# Altium project OmniCore_SDR.PrjPcb (part 1 of 3)
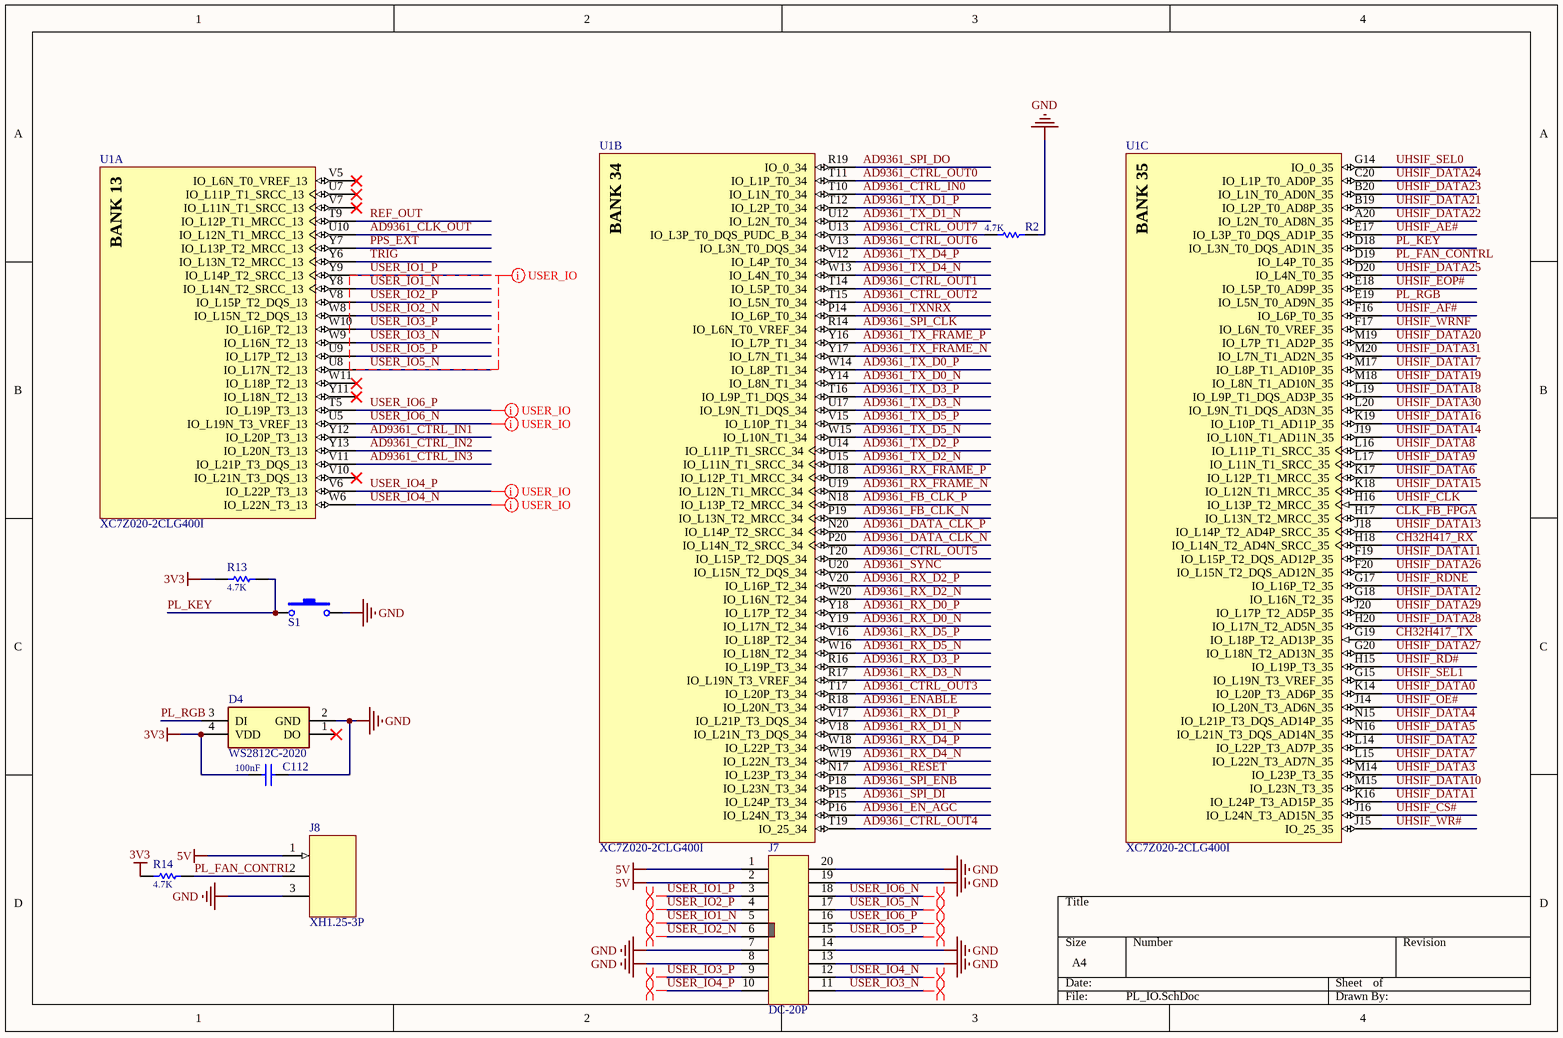
[diagram p0: PL_IO.SchDoc]
11 sheets, 534 parts. Net scope: global (net labels, ports and power ports of the same name join across sheets).
Board file: OmniCore_SDR.PcbDoc
Sheets:
  PL_IO.SchDoc
  PS_IO.SchDoc
  ZYNQ_Power.SchDoc
  DDR3.SchDoc
  LAN_SD.SchDoc
  JTAG.SchDoc
  AD9361.SchDoc
  AD9361_RF.SchDoc
  Sys_Power.SchDoc
  Clock.SchDoc
  CH32H417_USB3.SchDoc

## Sheet PL_IO.SchDoc
size A4; SheetNumber: 1; SheetTotal: 11

### Parts
C112  value 100nF  [C0402-L]  (hidden comment: Cap-S)
D4  WS2812C-2020  [WS2812C2020]
J7  DC-20P  [HDR-TH_20P-P2.54-V-M-R2-C10-S2.54]
J8  XH1.25-3P  [CONN-TH_3P-P1.25_CAX_1.25-3A]
R2  value 4.7K  [R0402-L]  (hidden comment: R)
R13  value 4.7K  [R0402-L]  (hidden comment: R)
R14  value 4.7K  [R0402-L]  (hidden comment: R)
S1  SW-PB2  [SW-PB2-SMD]  (value not drawn)
U1  XC7Z020-2CLG400I  [CLG400]  (parts A,B,C of 9)

### Nets
3V3: C112.1 D4.4(VDD) R13.1 R14.1
5V: J7.1 J7.2 J8.1
GND: C112.2 D4.2(GND) J7.7 J7.8 J7.13 J7.14 J7.19 J7.20 J8.3 R2.1 S1.2
AD9361_CLK_OUT: U1.U10(IO_L12N_T1_MRCC_13)
AD9361_CTRL_IN0: U1.T10(IO_L1N_T0_34)
AD9361_CTRL_IN1: U1.Y12(IO_L20P_T3_13)
AD9361_CTRL_IN2: U1.Y13(IO_L20N_T3_13)
AD9361_CTRL_IN3: U1.V11(IO_L21P_T3_DQS_13)
AD9361_CTRL_OUT0: U1.T11(IO_L1P_T0_34)
AD9361_CTRL_OUT1: U1.T14(IO_L5P_T0_34)
AD9361_CTRL_OUT2: U1.T15(IO_L5N_T0_34)
AD9361_CTRL_OUT3: U1.T17(IO_L20P_T3_34)
AD9361_CTRL_OUT4: U1.T19(IO_25_34)
AD9361_CTRL_OUT5: U1.T20(IO_L15P_T2_DQS_34)
AD9361_CTRL_OUT6: U1.V13(IO_L3N_T0_DQS_34)
AD9361_CTRL_OUT7: R2.2 U1.U13(IO_L3P_T0_DQS_PUDC_B_34)
AD9361_DATA_CLK_N: U1.P20(IO_L14N_T2_SRCC_34)
AD9361_DATA_CLK_P: U1.N20(IO_L14P_T2_SRCC_34)
AD9361_EN_AGC: U1.P16(IO_L24N_T3_34)
AD9361_ENABLE: U1.R18(IO_L20N_T3_34)
AD9361_FB_CLK_N: U1.P19(IO_L13N_T2_MRCC_34)
AD9361_FB_CLK_P: U1.N18(IO_L13P_T2_MRCC_34)
AD9361_RESET: U1.N17(IO_L23P_T3_34)
AD9361_RX_D0_N: U1.Y19(IO_L17N_T2_34)
AD9361_RX_D0_P: U1.Y18(IO_L17P_T2_34)
AD9361_RX_D1_N: U1.V18(IO_L21N_T3_DQS_34)
AD9361_RX_D1_P: U1.V17(IO_L21P_T3_DQS_34)
AD9361_RX_D2_N: U1.W20(IO_L16N_T2_34)
AD9361_RX_D2_P: U1.V20(IO_L16P_T2_34)
AD9361_RX_D3_N: U1.R17(IO_L19N_T3_VREF_34)
AD9361_RX_D3_P: U1.R16(IO_L19P_T3_34)
AD9361_RX_D4_N: U1.W19(IO_L22N_T3_34)
AD9361_RX_D4_P: U1.W18(IO_L22P_T3_34)
AD9361_RX_D5_N: U1.W16(IO_L18N_T2_34)
AD9361_RX_D5_P: U1.V16(IO_L18P_T2_34)
AD9361_RX_FRAME_N: U1.U19(IO_L12N_T1_MRCC_34)
AD9361_RX_FRAME_P: U1.U18(IO_L12P_T1_MRCC_34)
AD9361_SPI_CLK: U1.R14(IO_L6N_T0_VREF_34)
AD9361_SPI_DI: U1.P15(IO_L24P_T3_34)
AD9361_SPI_DO: U1.R19(IO_0_34)
AD9361_SPI_ENB: U1.P18(IO_L23N_T3_34)
AD9361_SYNC: U1.U20(IO_L15N_T2_DQS_34)
AD9361_TX_D0_N: U1.Y14(IO_L8N_T1_34)
AD9361_TX_D0_P: U1.W14(IO_L8P_T1_34)
AD9361_TX_D1_N: U1.U12(IO_L2N_T0_34)
AD9361_TX_D1_P: U1.T12(IO_L2P_T0_34)
AD9361_TX_D2_N: U1.U15(IO_L11N_T1_SRCC_34)
AD9361_TX_D2_P: U1.U14(IO_L11P_T1_SRCC_34)
AD9361_TX_D3_N: U1.U17(IO_L9N_T1_DQS_34)
AD9361_TX_D3_P: U1.T16(IO_L9P_T1_DQS_34)
AD9361_TX_D4_N: U1.W13(IO_L4N_T0_34)
AD9361_TX_D4_P: U1.V12(IO_L4P_T0_34)
AD9361_TX_D5_N: U1.W15(IO_L10N_T1_34)
AD9361_TX_D5_P: U1.V15(IO_L10P_T1_34)
AD9361_TX_FRAME_N: U1.Y17(IO_L7N_T1_34)
AD9361_TX_FRAME_P: U1.Y16(IO_L7P_T1_34)
AD9361_TXNRX: U1.P14(IO_L6P_T0_34)
CH32H417_RX: U1.H18(IO_L14N_T2_AD4N_SRCC_35)
CH32H417_TX: U1.G19(IO_L18P_T2_AD13P_35)
CLK_FB_FPGA: U1.H17(IO_L13N_T2_MRCC_35)
PL_FAN_CONTRL: J8.2 R14.2 U1.D19(IO_L4P_T0_35)
PL_KEY: R13.2 S1.1 U1.D18(IO_L3N_T0_DQS_AD1N_35)
PL_RGB: D4.3(DI) U1.E19(IO_L5N_T0_AD9N_35)
PPS_EXT: U1.Y7(IO_L13P_T2_MRCC_13)
REF_OUT: U1.T9(IO_L12P_T1_MRCC_13)
TRIG: U1.Y6(IO_L13N_T2_MRCC_13)
UHSIF_AE#: U1.E17(IO_L3P_T0_DQS_AD1P_35)
UHSIF_AF#: U1.F16(IO_L6P_T0_35)
UHSIF_CLK: U1.H16(IO_L13P_T2_MRCC_35)
UHSIF_CS#: U1.J16(IO_L24N_T3_AD15N_35)
UHSIF_DATA0: U1.K14(IO_L20P_T3_AD6P_35)
UHSIF_DATA1: U1.K16(IO_L24P_T3_AD15P_35)
UHSIF_DATA2: U1.L14(IO_L22P_T3_AD7P_35)
UHSIF_DATA3: U1.M14(IO_L23P_T3_35)
UHSIF_DATA4: U1.N15(IO_L21P_T3_DQS_AD14P_35)
UHSIF_DATA5: U1.N16(IO_L21N_T3_DQS_AD14N_35)
UHSIF_DATA6: U1.K17(IO_L12P_T1_MRCC_35)
UHSIF_DATA7: U1.L15(IO_L22N_T3_AD7N_35)
UHSIF_DATA8: U1.L16(IO_L11P_T1_SRCC_35)
UHSIF_DATA9: U1.L17(IO_L11N_T1_SRCC_35)
UHSIF_DATA10: U1.M15(IO_L23N_T3_35)
UHSIF_DATA11: U1.F19(IO_L15P_T2_DQS_AD12P_35)
UHSIF_DATA12: U1.G18(IO_L16N_T2_35)
UHSIF_DATA13: U1.J18(IO_L14P_T2_AD4P_SRCC_35)
UHSIF_DATA14: U1.J19(IO_L10N_T1_AD11N_35)
UHSIF_DATA15: U1.K18(IO_L12N_T1_MRCC_35)
UHSIF_DATA16: U1.K19(IO_L10P_T1_AD11P_35)
UHSIF_DATA17: U1.M17(IO_L8P_T1_AD10P_35)
UHSIF_DATA18: U1.L19(IO_L9P_T1_DQS_AD3P_35)
UHSIF_DATA19: U1.M18(IO_L8N_T1_AD10N_35)
UHSIF_DATA20: U1.M19(IO_L7P_T1_AD2P_35)
UHSIF_DATA21: U1.B19(IO_L2P_T0_AD8P_35)
UHSIF_DATA22: U1.A20(IO_L2N_T0_AD8N_35)
UHSIF_DATA23: U1.B20(IO_L1N_T0_AD0N_35)
UHSIF_DATA24: U1.C20(IO_L1P_T0_AD0P_35)
UHSIF_DATA25: U1.D20(IO_L4N_T0_35)
UHSIF_DATA26: U1.F20(IO_L15N_T2_DQS_AD12N_35)
UHSIF_DATA27: U1.G20(IO_L18N_T2_AD13N_35)
UHSIF_DATA28: U1.H20(IO_L17N_T2_AD5N_35)
UHSIF_DATA29: U1.J20(IO_L17P_T2_AD5P_35)
UHSIF_DATA30: U1.L20(IO_L9N_T1_DQS_AD3N_35)
UHSIF_DATA31: U1.M20(IO_L7N_T1_AD2N_35)
UHSIF_EOP#: U1.E18(IO_L5P_T0_AD9P_35)
UHSIF_OE#: U1.J14(IO_L20N_T3_AD6N_35)
UHSIF_RD#: U1.H15(IO_L19P_T3_35)
UHSIF_RDNE: U1.G17(IO_L16P_T2_35)
UHSIF_SEL0: U1.G14(IO_0_35)
UHSIF_SEL1: U1.G15(IO_L19N_T3_VREF_35)
UHSIF_WR#: U1.J15(IO_25_35)
UHSIF_WRNF: U1.F17(IO_L6N_T0_VREF_35)
USER_IO1_N: J7.5 U1.Y8(IO_L14N_T2_SRCC_13)
USER_IO1_P: J7.3 U1.Y9(IO_L14P_T2_SRCC_13)
USER_IO2_N: J7.6 U1.W8(IO_L15N_T2_DQS_13)
USER_IO2_P: J7.4 U1.V8(IO_L15P_T2_DQS_13)
USER_IO3_N: J7.11 U1.W9(IO_L16N_T2_13)
USER_IO3_P: J7.9 U1.W10(IO_L16P_T2_13)
USER_IO4_N: J7.12 U1.W6(IO_L22N_T3_13)
USER_IO4_P: J7.10 U1.V6(IO_L22P_T3_13)
USER_IO5_N: J7.17 U1.U8(IO_L17N_T2_13)
USER_IO5_P: J7.15 U1.U9(IO_L17P_T2_13)
USER_IO6_N: J7.18 U1.U5(IO_L19N_T3_VREF_13)
USER_IO6_P: J7.16 U1.T5(IO_L19P_T3_13)

Not connected (* = marked no-connect by the designer): D4 1(DO)*; U1 U7(IO_L11P_T1_SRCC_13)* V5(IO_L6N_T0_VREF_13)* V7(IO_L11N_T1_SRCC_13)* V10(IO_L21N_T3_DQS_13)* W11(IO_L18P_T2_13)* Y11(IO_L18N_T2_13)*

### Layout directives
net class USER_IO: USER_IO1_N, USER_IO1_P, USER_IO2_N, USER_IO2_P, USER_IO3_N, USER_IO3_P, USER_IO4_N, USER_IO4_P, USER_IO5_N, USER_IO5_P, USER_IO6_N, USER_IO6_P
differential pair: USER_IO1_N, USER_IO1_P, USER_IO2_N, USER_IO2_P, USER_IO3_N, USER_IO3_P, USER_IO4_N, USER_IO4_P, USER_IO5_N, USER_IO5_P, USER_IO6_N, USER_IO6_P

### Notes on the sheet
- (in symbol CMP-0363-00003-3, part A) BANK 13
- (in symbol CMP-0363-00003-3, part B) BANK 34
- (in symbol CMP-0363-00003-3, part C) BANK 35

### Library data of the parts
C112 = Cap-S: 贴片瓷片电容
D4 = WS2812C-2020: Intelligent control LED integrated light source; Manufacturer_Name: Worldsemi; Geometry.Height: 0.84mm; Manufacturer_Part_Number: WS2812C-2020; Mouser Part Number: *; Mouser Price/Stock: *; Arrow Part Number: *; Arrow Price/Stock: *; Datasheet Link: http://www.world-semi.com/DownLoadFile/139
R2 R13 R14 = Res: 贴片电阻
S1 = SW-PB2: 贴片式2脚微动开关
U1 = CMP-0363-00003-3: 733 MHz Zynq™-7000 AP SoC, 130 PS I/O, 125 FPGA I/O, 400-Ball BGA, Speed Grade 2, Industrial Grade, Pb-Free; LUTs: 53200; Flip Flops: 106400; Speed Grade: -2; Extensible Block RAM (# 36Kb Blocks): 560 KB (140); ComponentLink2URL: http://www.xilinx.com/support/documentation/user_guides/ug865-Zynq-7000-Pkg-Pinout.pdf; ComponentLink1Description: Datasheet; PartNumber: XC7Z020-2CLG400I; ComponentLink3URL: http://www.xilinx.com/support/documentation/data_sheets/ds187-XC7Z010-XC7Z020-Data-Sheet.pdf; Mounting Technology: Surface Mount; ComponentLink6Description: PCB and Layout Guide; ComponentLink3Description: DC and AC Switching Characteristics; ComponentLink4Description: Package File; PackageVersion: Rev 1.1, 09/2012; ComponentLink6URL: http://www.xilinx.com/support/documentation/user_guides/ug483_7Series_PCB.pdf; PackageDescription: Wire-Bond Chip-Scale BGA, Body 17 x 17 mm, 0.8 mm Pitch; ComponentLink5Description: Packaging and Pinout; Generic Part Number: XC7Z020; RoHS: Pb-Free; PackageReference: CLG400; ComponentLink1URL: http://www.xilinx.com/support/documentation/data_sheets/ds190-Zynq-7000-Overview.pdf; ComponentLink2Description: Package Specification; ComponentLink5URL: http://www.xilinx.com/support/documentation/user_guides/ug865-Zynq-7000-Pkg-Pinout.pdf; DatasheetVersion: v1.2; ComponentLink4URL: http://www.xilinx.com/support/packagefiles/z7packages/xc7z020clg400pkg.txt; Code_JEDEC: MO-275-MMAA-1

## Sheet PS_IO.SchDoc
size A4; SheetNumber: 2; SheetTotal: 11
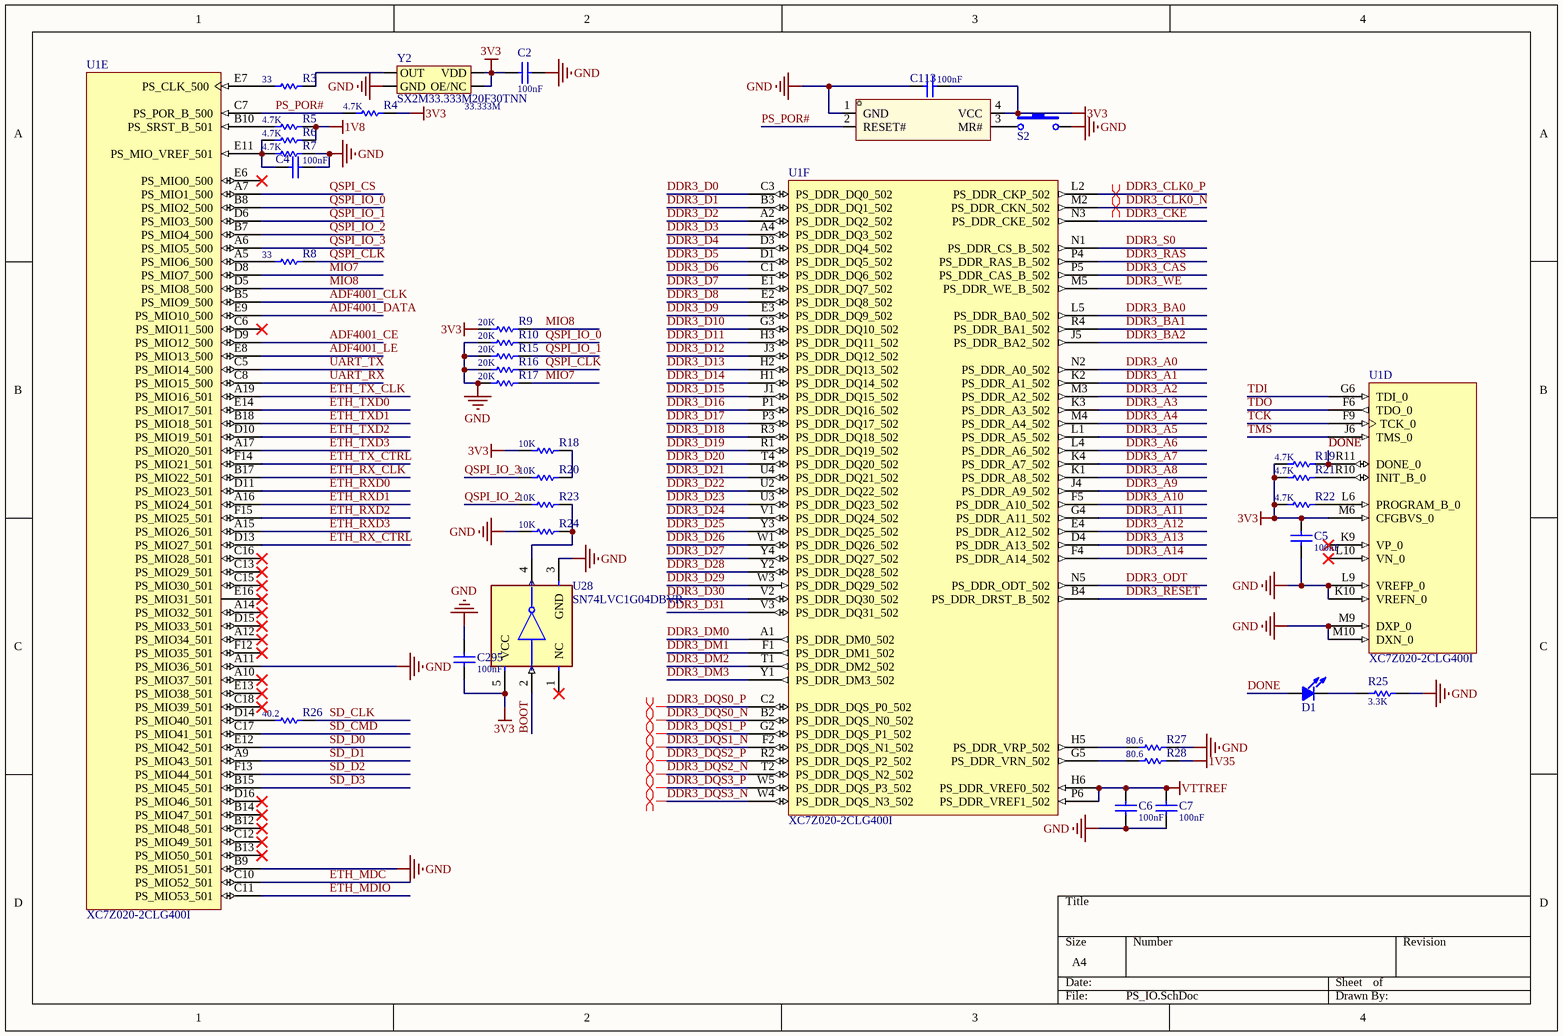
[diagram p1: PS_IO.SchDoc]

### Parts
C2  value 100nF  [C0402-L]  (hidden comment: Cap-S)
C4  value 100nF  [C0402-L]  (hidden comment: Cap-S)
C5  value 100nF  [C0402-L]  (hidden comment: Cap-S)
C6  value 100nF  [C0402-S]  (hidden comment: Cap-S)
C7  value 100nF  [C0402-S]  (hidden comment: Cap-S)
C113  value 100nF  [C0402-L]  (hidden comment: Cap-S)
C295  value 100nF  [C0402-L]  (hidden comment: Cap-S)
D1  LED  [LED_0603_L]  (value not drawn)
R3  value 33  [R0402-L]  (hidden comment: R)
R4  value 4.7K  [R0402-L]  (hidden comment: R)
R5  value 4.7K  [R0402-L]  (hidden comment: R)
R6  value 4.7K  [R0402-L]  (hidden comment: R)
R7  value 4.7K  [R0402-L]  (hidden comment: R)
R8  value 33  [R0402-L]  (hidden comment: R)
R9  value 20K  [R0402-L]  (hidden comment: R)
R10  value 20K  [R0402-L]  (hidden comment: R)
R15  value 20K  [R0402-L]  (hidden comment: R)
R16  value 20K  [R0402-L]  (hidden comment: R)
R17  value 20K  [R0402-L]  (hidden comment: R)
R18  value 10K  [R0402-L]  (hidden comment: R)
R19  value 4.7K  [R0402-L]  (hidden comment: R)
R20  value 10K  [R0402-L]  (hidden comment: R)
R21  value 4.7K  [R0402-L]  (hidden comment: R)
R22  value 4.7K  [R0402-L]  (hidden comment: R)
R23  value 10K  [R0402-L]  (hidden comment: R)
R24  value 10K  [R0402-L]  (hidden comment: R)
R25  value 3.3K  [R0603-L]  (hidden comment: R)
R26  value 40.2  [R0402-L]  (hidden comment: R)
R27  value 80.6  [R0402-S]  (hidden comment: R)
R28  value 80.6  [R0402-S]  (hidden comment: R)
S2  SW-PB2  [SW-PB2-SMD]  (value not drawn)
U1  XC7Z020-2CLG400I  [CLG400]  (parts D,E,F of 9)
U9  HX811T  [SOT-143_L2.9-W1.3-P1.92-LS2.3-BL]  (value not drawn)
U28  SN74LVC1G04DBVR  [FP-DBV0005A-IPC_C]
Y2  SX2M33.333M20F30TNN  value 33.333M  [XTAL-2520]

### Nets
1V8: R5.1 R6.1
1V35: R28.1
3V3: C2.2 C5.1 C113.1 C295.2 R4.1 R9.2 R18.2 R19.2 R21.2 R22.2 U1.M6(CFGBVS_0) U9.4(VCC) U28.5(VCC) Y2.1(OE/NC) Y2.4(VDD)
GND: C2.1 C4.1 C5.2 C6.1 C7.1 C113.2 C295.1 R7.1 R10.2 R15.2 R16.2 R17.2 R24.2 R25.2 R27.1 S2.2 U1.A11(PS_MIO36_501) U1.B9(PS_MIO51_501) U1.K10(VREFN_0) U1.L9(VREFP_0) U1.M9(DXP_0) U1.M10(DXN_0) U9.1(GND) U28.3(GND) Y2.2(GND)
VTTREF: C6.2 C7.2 U1.H6(PS_DDR_VREF0_502) U1.P6(PS_DDR_VREF1_502)
ADF4001_CE: U1.D9(PS_MIO12_500)
ADF4001_CLK: U1.B5(PS_MIO9_500)
ADF4001_DATA: U1.E9(PS_MIO10_500)
ADF4001_LE: U1.E8(PS_MIO13_500)
BOOT: U28.2(A)
DDR3_A0: U1.N2(PS_DDR_A0_502)
DDR3_A1: U1.K2(PS_DDR_A1_502)
DDR3_A2: U1.M3(PS_DDR_A2_502)
DDR3_A3: U1.K3(PS_DDR_A3_502)
DDR3_A4: U1.M4(PS_DDR_A4_502)
DDR3_A5: U1.L1(PS_DDR_A5_502)
DDR3_A6: U1.L4(PS_DDR_A6_502)
DDR3_A7: U1.K4(PS_DDR_A7_502)
DDR3_A8: U1.K1(PS_DDR_A8_502)
DDR3_A9: U1.J4(PS_DDR_A9_502)
DDR3_A10: U1.F5(PS_DDR_A10_502)
DDR3_A11: U1.G4(PS_DDR_A11_502)
DDR3_A12: U1.E4(PS_DDR_A12_502)
DDR3_A13: U1.D4(PS_DDR_A13_502)
DDR3_A14: U1.F4(PS_DDR_A14_502)
DDR3_BA0: U1.L5(PS_DDR_BA0_502)
DDR3_BA1: U1.R4(PS_DDR_BA1_502)
DDR3_BA2: U1.J5(PS_DDR_BA2_502)
DDR3_CAS: U1.P5(PS_DDR_CAS_B_502)
DDR3_CKE: U1.N3(PS_DDR_CKE_502)
DDR3_CLK0_N: U1.M2(PS_DDR_CKN_502)
DDR3_CLK0_P: U1.L2(PS_DDR_CKP_502)
DDR3_D0: U1.C3(PS_DDR_DQ0_502)
DDR3_D1: U1.B3(PS_DDR_DQ1_502)
DDR3_D2: U1.A2(PS_DDR_DQ2_502)
DDR3_D3: U1.A4(PS_DDR_DQ3_502)
DDR3_D4: U1.D3(PS_DDR_DQ4_502)
DDR3_D5: U1.D1(PS_DDR_DQ5_502)
DDR3_D6: U1.C1(PS_DDR_DQ6_502)
DDR3_D7: U1.E1(PS_DDR_DQ7_502)
DDR3_D8: U1.E2(PS_DDR_DQ8_502)
DDR3_D9: U1.E3(PS_DDR_DQ9_502)
DDR3_D10: U1.G3(PS_DDR_DQ10_502)
DDR3_D11: U1.H3(PS_DDR_DQ11_502)
DDR3_D12: U1.J3(PS_DDR_DQ12_502)
DDR3_D13: U1.H2(PS_DDR_DQ13_502)
DDR3_D14: U1.H1(PS_DDR_DQ14_502)
DDR3_D15: U1.J1(PS_DDR_DQ15_502)
DDR3_D16: U1.P1(PS_DDR_DQ16_502)
DDR3_D17: U1.P3(PS_DDR_DQ17_502)
DDR3_D18: U1.R3(PS_DDR_DQ18_502)
DDR3_D19: U1.R1(PS_DDR_DQ19_502)
DDR3_D20: U1.T4(PS_DDR_DQ20_502)
DDR3_D21: U1.U4(PS_DDR_DQ21_502)
DDR3_D22: U1.U2(PS_DDR_DQ22_502)
DDR3_D23: U1.U3(PS_DDR_DQ23_502)
DDR3_D24: U1.V1(PS_DDR_DQ24_502)
DDR3_D25: U1.Y3(PS_DDR_DQ25_502)
DDR3_D26: U1.W1(PS_DDR_DQ26_502)
DDR3_D27: U1.Y4(PS_DDR_DQ27_502)
DDR3_D28: U1.Y2(PS_DDR_DQ28_502)
DDR3_D29: U1.W3(PS_DDR_DQ29_502)
DDR3_D30: U1.V2(PS_DDR_DQ30_502)
DDR3_D31: U1.V3(PS_DDR_DQ31_502)
DDR3_DM0: U1.A1(PS_DDR_DM0_502)
DDR3_DM1: U1.F1(PS_DDR_DM1_502)
DDR3_DM2: U1.T1(PS_DDR_DM2_502)
DDR3_DM3: U1.Y1(PS_DDR_DM3_502)
DDR3_DQS0_N: U1.B2(PS_DDR_DQS_N0_502)
DDR3_DQS0_P: U1.C2(PS_DDR_DQS_P0_502)
DDR3_DQS1_N: U1.F2(PS_DDR_DQS_N1_502)
DDR3_DQS1_P: U1.G2(PS_DDR_DQS_P1_502)
DDR3_DQS2_N: U1.T2(PS_DDR_DQS_N2_502)
DDR3_DQS2_P: U1.R2(PS_DDR_DQS_P2_502)
DDR3_DQS3_N: U1.W4(PS_DDR_DQS_N3_502)
DDR3_DQS3_P: U1.W5(PS_DDR_DQS_P3_502)
DDR3_ODT: U1.N5(PS_DDR_ODT_502)
DDR3_RAS: U1.P4(PS_DDR_RAS_B_502)
DDR3_RESET: U1.B4(PS_DDR_DRST_B_502)
DDR3_S0: U1.N1(PS_DDR_CS_B_502)
DDR3_WE: U1.M5(PS_DDR_WE_B_502)
DONE: D1.1 R19.1 U1.R11(DONE_0)
ETH_MDC: U1.C10(PS_MIO52_501)
ETH_MDIO: U1.C11(PS_MIO53_501)
ETH_RX_CLK: U1.B17(PS_MIO22_501)
ETH_RX_CTRL: U1.D13(PS_MIO27_501)
ETH_RXD0: U1.D11(PS_MIO23_501)
ETH_RXD1: U1.A16(PS_MIO24_501)
ETH_RXD2: U1.F15(PS_MIO25_501)
ETH_RXD3: U1.A15(PS_MIO26_501)
ETH_TX_CLK: U1.A19(PS_MIO16_501)
ETH_TX_CTRL: U1.F14(PS_MIO21_501)
ETH_TXD0: U1.E14(PS_MIO17_501)
ETH_TXD1: U1.B18(PS_MIO18_501)
ETH_TXD2: U1.D10(PS_MIO19_501)
ETH_TXD3: U1.A17(PS_MIO20_501)
MIO7: R17.1 U1.D8(PS_MIO7_500)
MIO8: R9.1 U1.D5(PS_MIO8_500)
PS_POR#: R4.2 U1.C7(PS_POR_B_500) U9.2(RESET#)
QSPI_CLK: R8.1 R16.1
QSPI_CS: U1.A7(PS_MIO1_500)
QSPI_IO_0: R10.1 U1.B8(PS_MIO2_500)
QSPI_IO_1: R15.1 U1.D6(PS_MIO3_500)
QSPI_IO_2: R23.2 U1.B7(PS_MIO4_500)
QSPI_IO_3: R20.2 U1.A6(PS_MIO5_500)
SD_CLK: R26.1
SD_CMD: U1.C17(PS_MIO41_501)
SD_D0: U1.E12(PS_MIO42_501)
SD_D1: U1.A9(PS_MIO43_501)
SD_D2: U1.F13(PS_MIO44_501)
SD_D3: U1.B15(PS_MIO45_501)
TCK: U1.F9(TCK_0)
TDI: U1.G6(TDI_0)
TDO: U1.F6(TDO_0)
TMS: U1.J6(TMS_0)
UART_RX: U1.C8(PS_MIO15_500)
UART_TX: U1.C5(PS_MIO14_500)
NetC4_2: C4.2 R6.2 R7.2 U1.E11(PS_MIO_VREF_501)
NetD1_2: D1.2 R25.1
NetR3_1: R3.1 Y2.3(OUT)
NetR3_2: R3.2 U1.E7(PS_CLK_500)
NetR5_2: R5.2 U1.B10(PS_SRST_B_501)
NetR8_2: R8.2 U1.A5(PS_MIO6_500)
NetR18_1: R18.1 R20.1
NetR21_1: R21.1 U1.R10(INIT_B_0)
NetR22_1: R22.1 U1.L6(PROGRAM_B_0)
NetR23_1: R23.1 R24.1 U28.4(Y)
NetR26_2: R26.2 U1.D14(PS_MIO40_501)
NetR27_2: R27.2 U1.H5(PS_DDR_VRP_502)
NetR28_2: R28.2 U1.G5(PS_DDR_VRN_502)
NetS2_1: S2.1 U9.3(MR#)

Not connected (* = marked no-connect by the designer): U1 A10(PS_MIO37_501)* A12(PS_MIO34_501)* A14(PS_MIO32_501)* B12(PS_MIO48_501)* B13(PS_MIO50_501)* B14(PS_MIO47_501)* C6(PS_MIO11_500)* C12(PS_MIO49_501)* C13(PS_MIO29_501)* C15(PS_MIO30_501)* C16(PS_MIO28_501)* C18(PS_MIO39_501)* D15(PS_MIO33_501)* D16(PS_MIO46_501)* E6(PS_MIO0_500)* E13(PS_MIO38_501)* E16(PS_MIO31_501)* F12(PS_MIO35_501)* K9(VP_0)* L10(VN_0)*; U28 1(NC)*

### Layout directives
differential pair: DDR3_CLK0_N, DDR3_CLK0_P, DDR3_DQS0_N, DDR3_DQS0_P, DDR3_DQS1_N, DDR3_DQS1_P, DDR3_DQS2_N, DDR3_DQS2_P, DDR3_DQS3_N, DDR3_DQS3_P

### Library data of the parts
C2 C4-C7 C113 C295 = Cap-S: 贴片瓷片电容
D1 = LED: 发光二极管
R3-R10 R15-R28 = Res: 贴片电阻
S2 = SW-PB2: 贴片式2脚微动开关
U1 = CMP-0363-00003-3: as U1 on sheet PL_IO; ComponentLink2URL: http://www.xilinx.com/support/documentation/user_guides/ug865-Zynq-7000-Pkg-Pinout.pdf; ComponentLink1Description: Datasheet; PartNumber: XC7Z020-2CLG400I; ComponentLink3URL: http://www.xilinx.com/support/documentation/data_sheets/ds187-XC7Z010-XC7Z020-Data-Sheet.pdf; Mounting Technology: Surface Mount; ComponentLink6Description: PCB and Layout Guide; ComponentLink3Description: DC and AC Switching Characteristics; ComponentLink4Description: Package File; PackageVersion: Rev 1.1, 09/2012; ComponentLink6URL: http://www.xilinx.com/support/documentation/user_guides/ug483_7Series_PCB.pdf; PackageDescription: Wire-Bond Chip-Scale BGA, Body 17 x 17 mm, 0.8 mm Pitch; ComponentLink5Description: Packaging and Pinout; Generic Part Number: XC7Z020; RoHS: Pb-Free; PackageReference: CLG400; ComponentLink1URL: http://www.xilinx.com/support/documentation/data_sheets/ds190-Zynq-7000-Overview.pdf; ComponentLink2Description: Package Specification; ComponentLink5URL: http://www.xilinx.com/support/documentation/user_guides/ug865-Zynq-7000-Pkg-Pinout.pdf; DatasheetVersion: v1.2; ComponentLink4URL: http://www.xilinx.com/support/packagefiles/z7packages/xc7z020clg400pkg.txt; Code_JEDEC: MO-275-MMAA-1
U9 = HX811T: Manufacturer: HX(恒佳兴); Add into BOM: yes; Symbol: HX811T; Device: HX811T; LCSC Part Name: 检测复位IC  HX811T; Supplier Part: C296128; Manufacturer Part: HX811T; Supplier Footprint: SOT-143; JLCPCB Part Class: Extended Part; Datasheet: https://atta.szlcsc.com/upload/public/pdf/source/20181119/C296130_13C074D56463349345A6B8D040F0FFA0.pdf; Supplier: LCSC; Convert to PCB: yes
U28 = CMP-04903-000078-1: IC INVERTER 1CH 1-INP SOT23-5; Logic Function: Buffer; Number of Bits: 1; Voltage Rating (AC): 250V; Min Supply Voltage: 1.65V; Capacitance: 22nF; Propagation Delay: 3.7ns; Tolerance: 5%; High Level Output Current: -32mA; Turn-On Delay Time: 7.5ns; Voltage Rating (DC): 400V; Output Current: 32mA; Dielectric Material: PP; Quiescent Current: 10uA; Max Supply Voltage: 5.5V; REACH SVHC: No SVHC; Case/Package: SOT-23-5; Number of Pins: 5; Min Operating Temperature: -40°C; Technology: CMOS; Number of Inputs: 1; Weight: 0.000557oz; Radiation Hardening: No; Packaging: Tape and Reel; RoHS Compliant: Yes; Package Quantity: 3000; Number of Gates: 1; Lead Free: Lead Free; Termination: PC Pins; Mount: Surface Mount; Series: 74LVC; Number of Elements: 1; Number of Circuits: 1; Max Operating Temperature: 125°C; Low Level Output Current: 32mA
Y2 = XTALS: 贴片有源晶振

## Sheet ZYNQ_Power.SchDoc
size A4; SheetNumber: 3; SheetTotal: 11
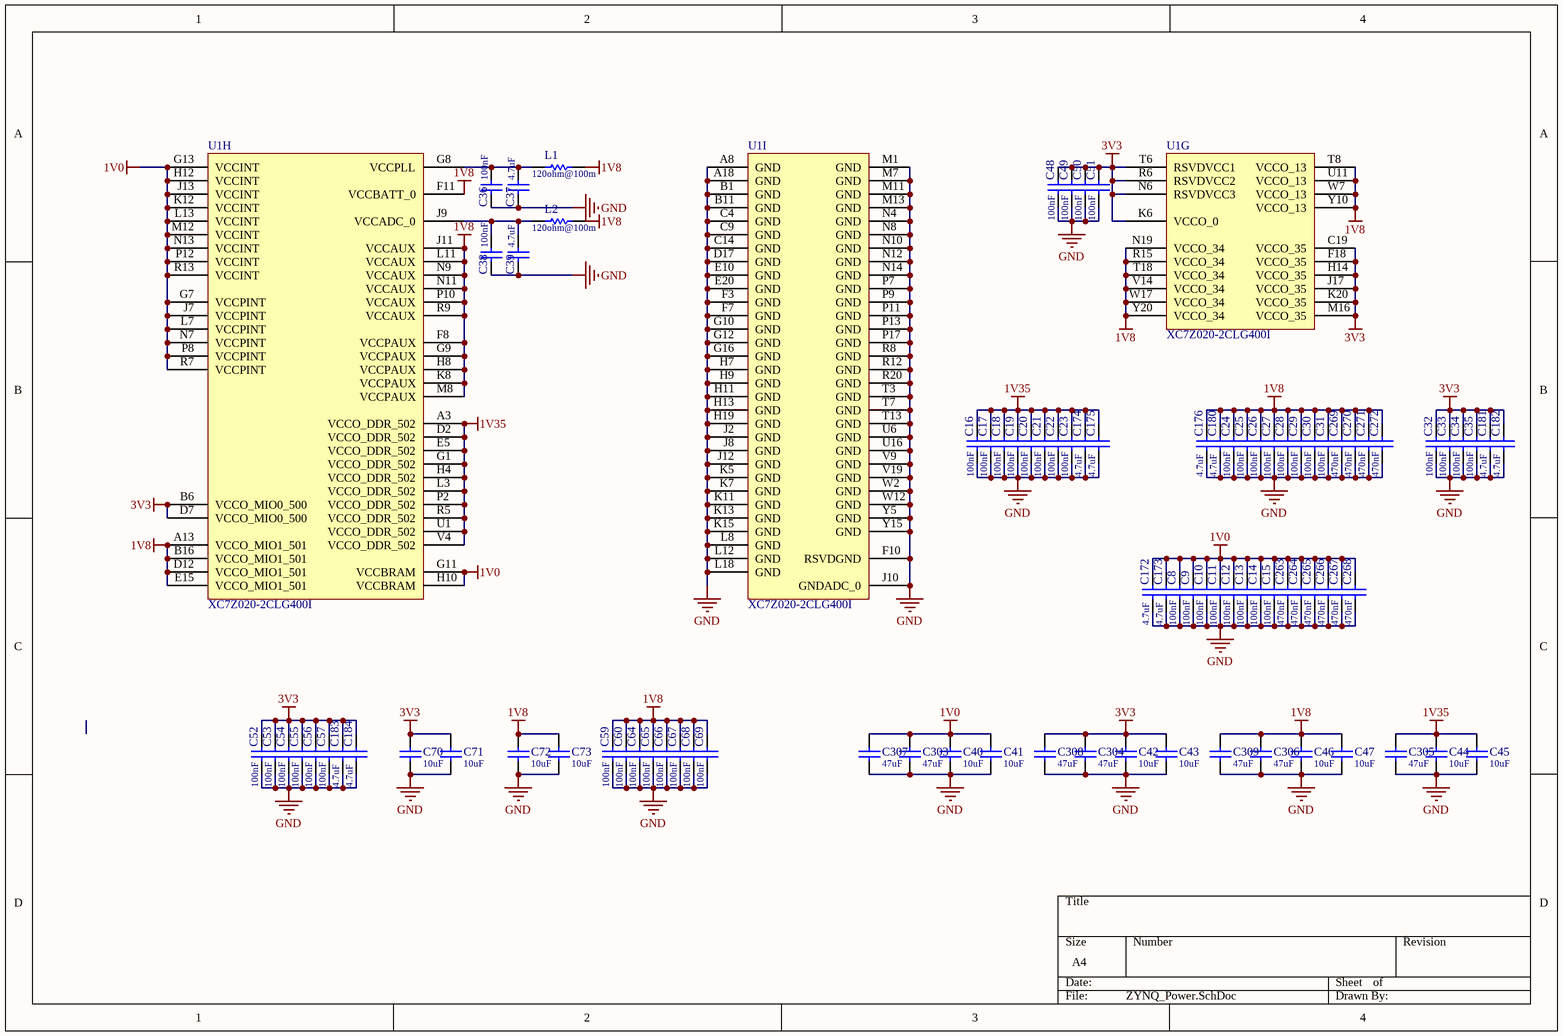
[diagram p2: ZYNQ_Power.SchDoc]

### Parts
C8  value 100nF  [C0402-S]  (hidden comment: Cap-S)
C9  value 100nF  [C0402-S]  (hidden comment: Cap-S)
C10  value 100nF  [C0402-S]  (hidden comment: Cap-S)
C11  value 100nF  [C0402-S]  (hidden comment: Cap-S)
C12  value 100nF  [C0402-S]  (hidden comment: Cap-S)
C13  value 100nF  [C0402-S]  (hidden comment: Cap-S)
C14  value 100nF  [C0402-S]  (hidden comment: Cap-S)
C15  value 100nF  [C0402-S]  (hidden comment: Cap-S)
C16  value 100nF  [C0402-S]  (hidden comment: Cap-S)
C17  value 100nF  [C0402-S]  (hidden comment: Cap-S)
C18  value 100nF  [C0402-S]  (hidden comment: Cap-S)
C19  value 100nF  [C0402-S]  (hidden comment: Cap-S)
C20  value 100nF  [C0402-S]  (hidden comment: Cap-S)
C21  value 100nF  [C0402-S]  (hidden comment: Cap-S)
C22  value 100nF  [C0402-S]  (hidden comment: Cap-S)
C23  value 100nF  [C0402-S]  (hidden comment: Cap-S)
C24  value 100nF  [C0402-S]  (hidden comment: Cap-S)
C25  value 100nF  [C0402-S]  (hidden comment: Cap-S)
C26  value 100nF  [C0402-S]  (hidden comment: Cap-S)
C27  value 100nF  [C0402-S]  (hidden comment: Cap-S)
C28  value 100nF  [C0402-S]  (hidden comment: Cap-S)
C29  value 100nF  [C0402-S]  (hidden comment: Cap-S)
C30  value 100nF  [C0402-S]  (hidden comment: Cap-S)
C31  value 100nF  [C0402-S]  (hidden comment: Cap-S)
C32  value 100nF  [C0402-S]  (hidden comment: Cap-S)
C33  value 100nF  [C0402-S]  (hidden comment: Cap-S)
C34  value 100nF  [C0402-S]  (hidden comment: Cap-S)
C35  value 100nF  [C0402-S]  (hidden comment: Cap-S)
C36  value 100nF  [C0402-S]  (hidden comment: Cap-S)
C37  value 4.7uF  [C0402-S]  (hidden comment: Cap-S)
C38  value 100nF  [C0402-S]  (hidden comment: Cap-S)
C39  value 4.7uF  [C0402-S]  (hidden comment: Cap-S)
C40  value 10uF  [C0402-S]  (hidden comment: Cap-S)
C41  value 10uF  [C0402-S]  (hidden comment: Cap-S)
C42  value 10uF  [C0402-S]  (hidden comment: Cap-S)
C43  value 10uF  [C0402-S]  (hidden comment: Cap-S)
C44  value 10uF  [C0402-S]  (hidden comment: Cap-S)
C45  value 10uF  [C0402-S]  (hidden comment: Cap-S)
C46  value 10uF  [C0402-S]  (hidden comment: Cap-S)
C47  value 10uF  [C0402-S]  (hidden comment: Cap-S)
C48  value 100nF  [C0402-S]  (hidden comment: Cap-S)
C49  value 100nF  [C0402-S]  (hidden comment: Cap-S)
C50  value 100nF  [C0402-S]  (hidden comment: Cap-S)
C51  value 100nF  [C0402-S]  (hidden comment: Cap-S)
C52  value 100nF  [C0402-S]  (hidden comment: Cap-S)
C53  value 100nF  [C0402-S]  (hidden comment: Cap-S)
C54  value 100nF  [C0402-S]  (hidden comment: Cap-S)
C55  value 100nF  [C0402-S]  (hidden comment: Cap-S)
C56  value 100nF  [C0402-S]  (hidden comment: Cap-S)
C57  value 100nF  [C0402-S]  (hidden comment: Cap-S)
C59  value 100nF  [C0402-S]  (hidden comment: Cap-S)
C60  value 100nF  [C0402-S]  (hidden comment: Cap-S)
C64  value 100nF  [C0402-S]  (hidden comment: Cap-S)
C65  value 100nF  [C0402-S]  (hidden comment: Cap-S)
C66  value 100nF  [C0402-S]  (hidden comment: Cap-S)
C67  value 100nF  [C0402-S]  (hidden comment: Cap-S)
C68  value 100nF  [C0402-S]  (hidden comment: Cap-S)
C69  value 100nF  [C0402-S]  (hidden comment: Cap-S)
C70  value 10uF  [C0402-S]  (hidden comment: Cap-S)
C71  value 10uF  [C0402-S]  (hidden comment: Cap-S)
C72  value 10uF  [C0402-S]  (hidden comment: Cap-S)
C73  value 10uF  [C0402-S]  (hidden comment: Cap-S)
C172  value 4.7uF  [C0402-S]  (hidden comment: Cap-S)
C173  value 4.7uF  [C0402-S]  (hidden comment: Cap-S)
C174  value 4.7uF  [C0402-S]  (hidden comment: Cap-S)
C175  value 4.7uF  [C0402-S]  (hidden comment: Cap-S)
C176  value 4.7uF  [C0402-S]  (hidden comment: Cap-S)
C180  value 4.7uF  [C0402-S]  (hidden comment: Cap-S)
C181  value 4.7uF  [C0402-S]  (hidden comment: Cap-S)
C182  value 4.7uF  [C0402-S]  (hidden comment: Cap-S)
C183  value 4.7uF  [C0402-S]  (hidden comment: Cap-S)
C184  value 4.7uF  [C0402-S]  (hidden comment: Cap-S)
C263  value 470nF  [C0402-S]  (hidden comment: Cap-S)
C264  value 470nF  [C0402-S]  (hidden comment: Cap-S)
C265  value 470nF  [C0402-S]  (hidden comment: Cap-S)
C266  value 470nF  [C0402-S]  (hidden comment: Cap-S)
C267  value 470nF  [C0402-S]  (hidden comment: Cap-S)
C268  value 470nF  [C0402-S]  (hidden comment: Cap-S)
C269  value 470nF  [C0402-S]  (hidden comment: Cap-S)
C270  value 470nF  [C0402-S]  (hidden comment: Cap-S)
C271  value 470nF  [C0402-S]  (hidden comment: Cap-S)
C272  value 470nF  [C0402-S]  (hidden comment: Cap-S)
C303  value 47uF  [C0603-L]  (hidden comment: Cap-S)
C304  value 47uF  [C0603-L]  (hidden comment: Cap-S)
C305  value 47uF  [C0603-L]  (hidden comment: Cap-S)
C306  value 47uF  [C0603-L]  (hidden comment: Cap-S)
C307  value 47uF  [C0603-L]  (hidden comment: Cap-S)
C308  value 47uF  [C0603-L]  (hidden comment: Cap-S)
C309  value 47uF  [C0603-L]  (hidden comment: Cap-S)
L1  value 120ohm@100m  [R0603-L]  (hidden comment: R)
L2  value 120ohm@100m  [R0603-L]  (hidden comment: R)
U1  XC7Z020-2CLG400I  [CLG400]  (parts G,H,I of 9)

### Nets
1V0: C8.2 C9.2 C10.2 C11.2 C12.2 C13.2 C14.2 C15.2 C40.2 C41.2 C172.2 C173.2 C263.2 C264.2 C265.2 C266.2 C267.2 C268.2 C303.2 C307.2 U1.G7(VCCPINT) U1.G11(VCCBRAM) U1.G13(VCCINT) U1.H10(VCCBRAM) U1.H12(VCCINT) U1.J7(VCCPINT) U1.J13(VCCINT) U1.K12(VCCINT) U1.L7(VCCPINT) U1.L13(VCCINT) U1.M12(VCCINT) U1.N7(VCCPINT) U1.N13(VCCINT) U1.P8(VCCPINT) U1.P12(VCCINT) U1.R7(VCCPINT) U1.R13(VCCINT)
1V8: C24.2 C25.2 C26.2 C27.2 C28.2 C29.2 C30.2 C31.2 C46.2 C47.2 C59.2 C60.2 C64.2 C65.2 C66.2 C67.2 C68.2 C69.2 C72.2 C73.2 C176.2 C180.2 C269.2 C270.2 C271.2 C272.2 C306.2 C309.2 L1.2 L2.2 U1.A13(VCCO_MIO1_501) U1.B16(VCCO_MIO1_501) U1.D12(VCCO_MIO1_501) U1.E15(VCCO_MIO1_501) U1.F8(VCCPAUX) U1.F11(VCCBATT_0) U1.G9(VCCPAUX) U1.H8(VCCPAUX) U1.J11(VCCAUX) U1.K8(VCCPAUX) U1.L11(VCCAUX) U1.M8(VCCPAUX) U1.N9(VCCAUX) U1.N11(VCCAUX) U1.N19(VCCO_34) U1.P10(VCCAUX) U1.R9(VCCAUX) U1.R15(VCCO_34) U1.T8(VCCO_13) U1.T18(VCCO_34) U1.U11(VCCO_13) U1.V14(VCCO_34) U1.W7(VCCO_13) U1.W17(VCCO_34) U1.Y10(VCCO_13) U1.Y20(VCCO_34)
1V35: C16.2 C17.2 C18.2 C19.2 C20.2 C21.2 C22.2 C23.2 C44.2 C45.2 C174.2 C175.2 C305.2 U1.A3(VCCO_DDR_502) U1.D2(VCCO_DDR_502) U1.E5(VCCO_DDR_502) U1.G1(VCCO_DDR_502) U1.H4(VCCO_DDR_502) U1.L3(VCCO_DDR_502) U1.P2(VCCO_DDR_502) U1.R5(VCCO_DDR_502) U1.U1(VCCO_DDR_502) U1.V4(VCCO_DDR_502)
3V3: C32.2 C33.2 C34.2 C35.2 C42.2 C43.2 C48.2 C49.2 C50.2 C51.2 C52.2 C53.2 C54.2 C55.2 C56.2 C57.2 C70.2 C71.2 C181.2 C182.2 C183.2 C184.2 C304.2 C308.2 U1.B6(VCCO_MIO0_500) U1.C19(VCCO_35) U1.D7(VCCO_MIO0_500) U1.F18(VCCO_35) U1.H14(VCCO_35) U1.J17(VCCO_35) U1.K6(VCCO_0) U1.K20(VCCO_35) U1.M16(VCCO_35) U1.N6(RSVDVCC3) U1.R6(RSVDVCC2) U1.T6(RSVDVCC1)
GND: C8.1 C9.1 C10.1 C11.1 C12.1 C13.1 C14.1 C15.1 C16.1 C17.1 C18.1 C19.1 C20.1 C21.1 C22.1 C23.1 C24.1 C25.1 C26.1 C27.1 C28.1 C29.1 C30.1 C31.1 C32.1 C33.1 C34.1 C35.1 C36.1 C37.1 C38.1 C39.1 C40.1 C41.1 C42.1 C43.1 C44.1 C45.1 C46.1 C47.1 C48.1 C49.1 C50.1 C51.1 C52.1 C53.1 C54.1 C55.1 C56.1 C57.1 C59.1 C60.1 C64.1 C65.1 C66.1 C67.1 C68.1 C69.1 C70.1 C71.1 C72.1 C73.1 C172.1 C173.1 C174.1 C175.1 C176.1 C180.1 C181.1 C182.1 C183.1 C184.1 C263.1 C264.1 C265.1 C266.1 C267.1 C268.1 C269.1 C270.1 C271.1 C272.1 C303.1 C304.1 C305.1 C306.1 C307.1 C308.1 C309.1 U1.A8(GND) U1.A18(GND) U1.B1(GND) U1.B11(GND) U1.C4(GND) U1.C9(GND) U1.C14(GND) U1.D17(GND) U1.E10(GND) U1.E20(GND) U1.F3(GND) U1.F7(GND) U1.F10(RSVDGND) U1.G10(GND) U1.G12(GND) U1.G16(GND) U1.H7(GND) U1.H9(GND) U1.H11(GND) U1.H13(GND) U1.H19(GND) U1.J2(GND) U1.J8(GND) U1.J10(GNDADC_0) U1.J12(GND) U1.K5(GND) U1.K7(GND) U1.K11(GND) U1.K13(GND) U1.K15(GND) U1.L8(GND) U1.L12(GND) U1.L18(GND) U1.M1(GND) U1.M7(GND) U1.M11(GND) U1.M13(GND) U1.N4(GND) U1.N8(GND) U1.N10(GND) U1.N12(GND) U1.N14(GND) U1.P7(GND) U1.P9(GND) U1.P11(GND) U1.P13(GND) U1.P17(GND) U1.R8(GND) U1.R12(GND) U1.R20(GND) U1.T3(GND) U1.T7(GND) U1.T13(GND) U1.U6(GND) U1.U16(GND) U1.V9(GND) U1.V19(GND) U1.W2(GND) U1.W12(GND) U1.Y5(GND) U1.Y15(GND)
NetC36_2: C36.2 C37.2 L1.1 U1.G8(VCCPLL)
NetC38_2: C38.2 C39.2 L2.1 U1.J9(VCCADC_0)

### Library data of the parts
C8-C57 C59 C60 C64-C73 C172-C176 C180-C184 C263-C272 C303-C309 = Cap-S: 贴片瓷片电容
L1 L2 = Res: 贴片电阻
U1 = CMP-0363-00003-3: as U1 on sheet PL_IO; ComponentLink2URL: http://www.xilinx.com/support/documentation/user_guides/ug865-Zynq-7000-Pkg-Pinout.pdf; ComponentLink1Description: Datasheet; PartNumber: XC7Z020-2CLG400I; ComponentLink3URL: http://www.xilinx.com/support/documentation/data_sheets/ds187-XC7Z010-XC7Z020-Data-Sheet.pdf; Mounting Technology: Surface Mount; ComponentLink6Description: PCB and Layout Guide; ComponentLink3Description: DC and AC Switching Characteristics; ComponentLink4Description: Package File; PackageVersion: Rev 1.1, 09/2012; ComponentLink6URL: http://www.xilinx.com/support/documentation/user_guides/ug483_7Series_PCB.pdf; PackageDescription: Wire-Bond Chip-Scale BGA, Body 17 x 17 mm, 0.8 mm Pitch; ComponentLink5Description: Packaging and Pinout; Generic Part Number: XC7Z020; RoHS: Pb-Free; PackageReference: CLG400; ComponentLink1URL: http://www.xilinx.com/support/documentation/data_sheets/ds190-Zynq-7000-Overview.pdf; ComponentLink2Description: Package Specification; ComponentLink5URL: http://www.xilinx.com/support/documentation/user_guides/ug865-Zynq-7000-Pkg-Pinout.pdf; DatasheetVersion: v1.2; ComponentLink4URL: http://www.xilinx.com/support/packagefiles/z7packages/xc7z020clg400pkg.txt; Code_JEDEC: MO-275-MMAA-1

## Sheet DDR3.SchDoc
size A4; SheetNumber: 4; SheetTotal: 11
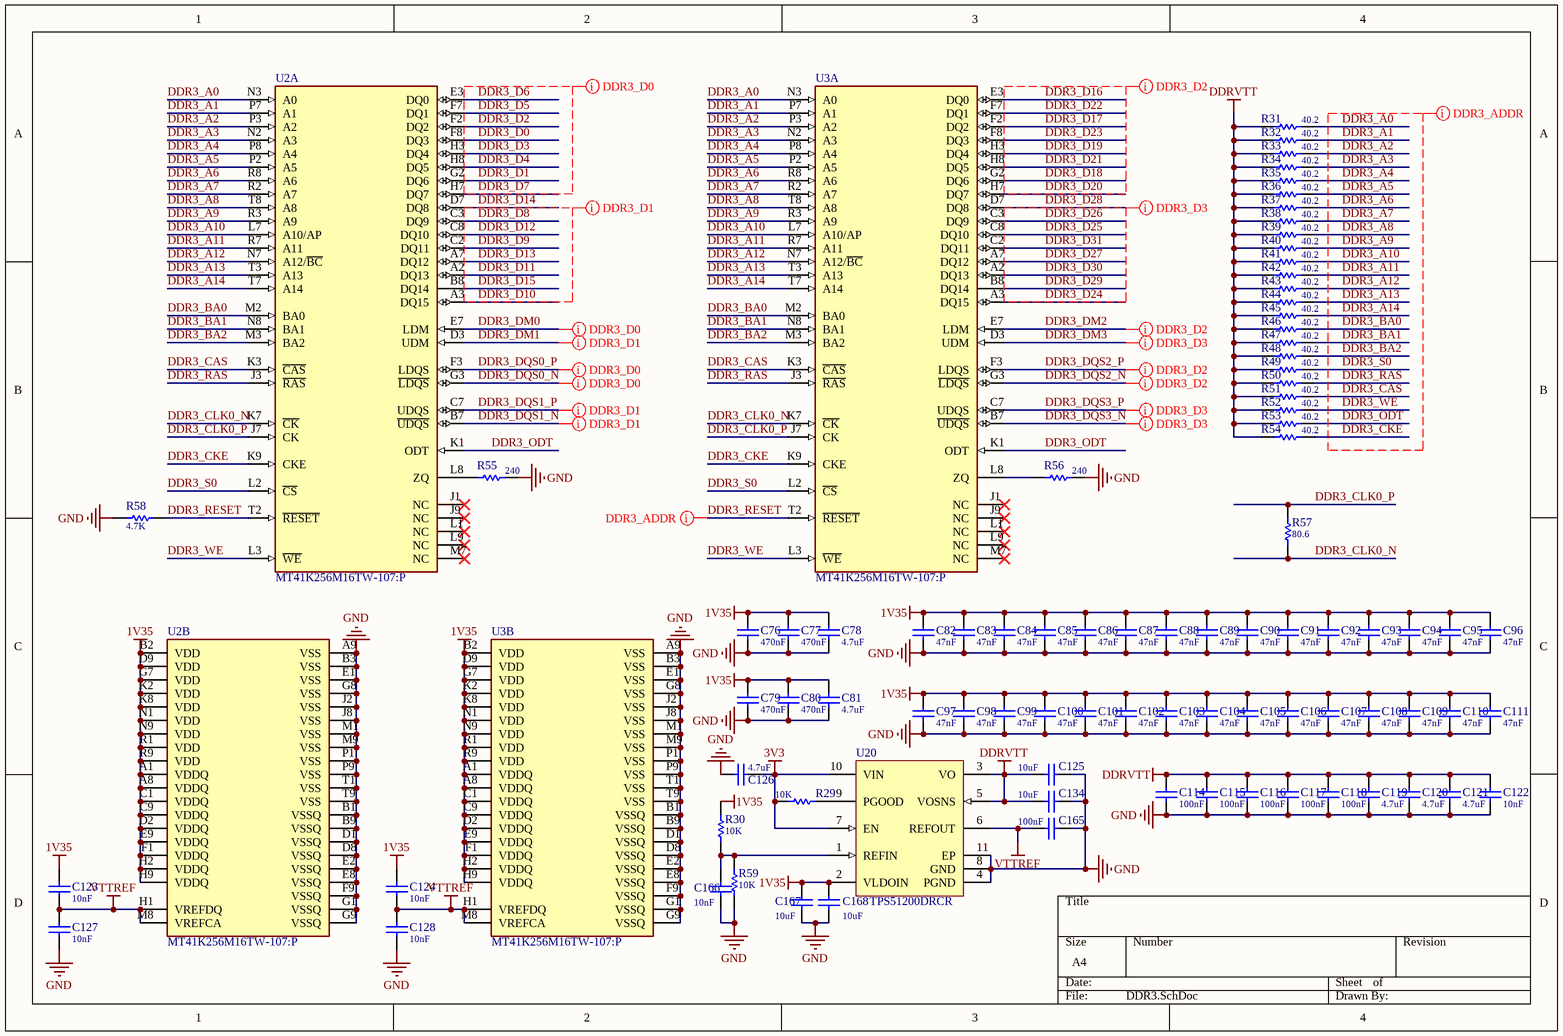
[diagram p3: DDR3.SchDoc]

### Parts
C76  value 470nF  [C0402-L]  (hidden comment: Cap-S)
C77  value 470nF  [C0402-L]  (hidden comment: Cap-S)
C78  value 4.7uF  [C0402-L]  (hidden comment: Cap-S)
C79  value 470nF  [C0402-L]  (hidden comment: Cap-S)
C80  value 470nF  [C0402-L]  (hidden comment: Cap-S)
C81  value 4.7uF  [C0402-L]  (hidden comment: Cap-S)
C82  value 47nF  [C0402-L]  (hidden comment: Cap-S)
C83  value 47nF  [C0402-L]  (hidden comment: Cap-S)
C84  value 47nF  [C0402-L]  (hidden comment: Cap-S)
C85  value 47nF  [C0402-L]  (hidden comment: Cap-S)
C86  value 47nF  [C0402-L]  (hidden comment: Cap-S)
C87  value 47nF  [C0402-L]  (hidden comment: Cap-S)
C88  value 47nF  [C0402-L]  (hidden comment: Cap-S)
C89  value 47nF  [C0402-L]  (hidden comment: Cap-S)
C90  value 47nF  [C0402-L]  (hidden comment: Cap-S)
C91  value 47nF  [C0402-L]  (hidden comment: Cap-S)
C92  value 47nF  [C0402-L]  (hidden comment: Cap-S)
C93  value 47nF  [C0402-L]  (hidden comment: Cap-S)
C94  value 47nF  [C0402-L]  (hidden comment: Cap-S)
C95  value 47nF  [C0402-L]  (hidden comment: Cap-S)
C96  value 47nF  [C0402-L]  (hidden comment: Cap-S)
C97  value 47nF  [C0402-L]  (hidden comment: Cap-S)
C98  value 47nF  [C0402-L]  (hidden comment: Cap-S)
C99  value 47nF  [C0402-L]  (hidden comment: Cap-S)
C100  value 47nF  [C0402-L]  (hidden comment: Cap-S)
C101  value 47nF  [C0402-L]  (hidden comment: Cap-S)
C102  value 47nF  [C0402-L]  (hidden comment: Cap-S)
C103  value 47nF  [C0402-L]  (hidden comment: Cap-S)
C104  value 47nF  [C0402-L]  (hidden comment: Cap-S)
C105  value 47nF  [C0402-L]  (hidden comment: Cap-S)
C106  value 47nF  [C0402-L]  (hidden comment: Cap-S)
C107  value 47nF  [C0402-L]  (hidden comment: Cap-S)
C108  value 47nF  [C0402-L]  (hidden comment: Cap-S)
C109  value 47nF  [C0402-L]  (hidden comment: Cap-S)
C110  value 47nF  [C0402-L]  (hidden comment: Cap-S)
C111  value 47nF  [C0402-L]  (hidden comment: Cap-S)
C114  value 100nF  [C0402-L]  (hidden comment: Cap-S)
C115  value 100nF  [C0402-L]  (hidden comment: Cap-S)
C116  value 100nF  [C0402-L]  (hidden comment: Cap-S)
C117  value 100nF  [C0402-L]  (hidden comment: Cap-S)
C118  value 100nF  [C0402-L]  (hidden comment: Cap-S)
C119  value 4.7uF  [C0402-L]  (hidden comment: Cap-S)
C120  value 4.7uF  [C0402-L]  (hidden comment: Cap-S)
C121  value 4.7uF  [C0402-L]  (hidden comment: Cap-S)
C122  value 10nF  [C0402-L]  (hidden comment: Cap-S)
C123  value 10nF  [C0402-L]  (hidden comment: Cap-S)
C124  value 10nF  [C0402-L]  (hidden comment: Cap-S)
C125  value 10uF  [C0603-L]  (hidden comment: Cap-S)
C126  value 4.7uF  [C0603-L]  (hidden comment: Cap-S)
C127  value 10nF  [C0402-L]  (hidden comment: Cap-S)
C128  value 10nF  [C0402-L]  (hidden comment: Cap-S)
C134  value 10uF  [C0603-L]  (hidden comment: Cap-S)
C165  value 100nF  [C0402-L]  (hidden comment: Cap-S)
C166  value 10nF  [C0402-L]  (hidden comment: Cap-S)
C167  value 10uF  [C0603-L]  (hidden comment: Cap-S)
C168  value 10uF  [C0603-L]  (hidden comment: Cap-S)
R29  value 10K  [R0402-L]  (hidden comment: R)
R30  value 10K  [R0402-L]  (hidden comment: R)
R31  value 40.2  [R0402-L]  (hidden comment: R)
R32  value 40.2  [R0402-L]  (hidden comment: R)
R33  value 40.2  [R0402-L]  (hidden comment: R)
R34  value 40.2  [R0402-L]  (hidden comment: R)
R35  value 40.2  [R0402-L]  (hidden comment: R)
R36  value 40.2  [R0402-L]  (hidden comment: R)
R37  value 40.2  [R0402-L]  (hidden comment: R)
R38  value 40.2  [R0402-L]  (hidden comment: R)
R39  value 40.2  [R0402-L]  (hidden comment: R)
R40  value 40.2  [R0402-L]  (hidden comment: R)
R41  value 40.2  [R0402-L]  (hidden comment: R)
R42  value 40.2  [R0402-L]  (hidden comment: R)
R43  value 40.2  [R0402-L]  (hidden comment: R)
R44  value 40.2  [R0402-L]  (hidden comment: R)
R45  value 40.2  [R0402-L]  (hidden comment: R)
R46  value 40.2  [R0402-L]  (hidden comment: R)
R47  value 40.2  [R0402-L]  (hidden comment: R)
R48  value 40.2  [R0402-L]  (hidden comment: R)
R49  value 40.2  [R0402-L]  (hidden comment: R)
R50  value 40.2  [R0402-L]  (hidden comment: R)
R51  value 40.2  [R0402-L]  (hidden comment: R)
R52  value 40.2  [R0402-L]  (hidden comment: R)
R53  value 40.2  [R0402-L]  (hidden comment: R)
R54  value 40.2  [R0402-L]  (hidden comment: R)
R55  value 240  [R0402-L]  (hidden comment: R)
R56  value 240  [R0402-L]  (hidden comment: R)
R57  value 80.6  [R0402-L]  (hidden comment: R)
R58  value 4.7K  [R0402-L]  (hidden comment: R)
R59  value 10K  [R0402-L]  (hidden comment: R)
U2  MT41K256M16TW-107:P  [FP-TW-IPC_C]  (parts A,B of 2)
U3  MT41K256M16TW-107:P  [FP-TW-IPC_C]  (parts A,B of 2)
U20  TPS51200DRCR  [DRC0010J_V]

### Nets
1V35: C76.2 C77.2 C78.2 C79.2 C80.2 C81.2 C82.2 C83.2 C84.2 C85.2 C86.2 C87.2 C88.2 C89.2 C90.2 C91.2 C92.2 C93.2 C94.2 C95.2 C96.2 C97.2 C98.2 C99.2 C100.2 C101.2 C102.2 C103.2 C104.2 C105.2 C106.2 C107.2 C108.2 C109.2 C110.2 C111.2 C123.2 C124.2 C167.1 C168.1 R30.2 U2.A1(VDDQ) U2.A8(VDDQ) U2.B2(VDD) U2.C1(VDDQ) U2.C9(VDDQ) U2.D2(VDDQ) U2.D9(VDD) U2.E9(VDDQ) U2.F1(VDDQ) U2.G7(VDD) U2.H2(VDDQ) U2.H9(VDDQ) U2.K2(VDD) U2.K8(VDD) U2.N1(VDD) U2.N9(VDD) U2.R1(VDD) U2.R9(VDD) U3.A1(VDDQ) U3.A8(VDDQ) U3.B2(VDD) U3.C1(VDDQ) U3.C9(VDDQ) U3.D2(VDDQ) U3.D9(VDD) U3.E9(VDDQ) U3.F1(VDDQ) U3.G7(VDD) U3.H2(VDDQ) U3.H9(VDDQ) U3.K2(VDD) U3.K8(VDD) U3.N1(VDD) U3.N9(VDD) U3.R1(VDD) U3.R9(VDD) U20.2(VLDOIN)
3V3: C126.1 R29.2 U20.7(EN) U20.10(VIN)
DDRVTT: C114.2 C115.2 C116.2 C117.2 C118.2 C119.2 C120.2 C121.2 C122.2 C125.1 C134.1 R31.1 R32.1 R33.1 R34.1 R35.1 R36.1 R37.1 R38.1 R39.1 R40.1 R41.1 R42.1 R43.1 R44.1 R45.1 R46.1 R47.1 R48.1 R49.1 R50.1 R51.1 R52.1 R53.1 R54.1 U20.3(VO) U20.5(VOSNS)
GND: C76.1 C77.1 C78.1 C79.1 C80.1 C81.1 C82.1 C83.1 C84.1 C85.1 C86.1 C87.1 C88.1 C89.1 C90.1 C91.1 C92.1 C93.1 C94.1 C95.1 C96.1 C97.1 C98.1 C99.1 C100.1 C101.1 C102.1 C103.1 C104.1 C105.1 C106.1 C107.1 C108.1 C109.1 C110.1 C111.1 C114.1 C115.1 C116.1 C117.1 C118.1 C119.1 C120.1 C121.1 C122.1 C125.2 C126.2 C127.1 C128.1 C134.2 C165.2 C166.2 C167.2 C168.2 R55.2 R56.2 R58.2 R59.1 U2.A9(VSS) U2.B1(VSSQ) U2.B3(VSS) U2.B9(VSSQ) U2.D1(VSSQ) U2.D8(VSSQ) U2.E1(VSS) U2.E2(VSSQ) U2.E8(VSSQ) U2.F9(VSSQ) U2.G1(VSSQ) U2.G8(VSS) U2.G9(VSSQ) U2.J2(VSS) U2.J8(VSS) U2.M1(VSS) U2.M9(VSS) U2.P1(VSS) U2.P9(VSS) U2.T1(VSS) U2.T9(VSS) U3.A9(VSS) U3.B1(VSSQ) U3.B3(VSS) U3.B9(VSSQ) U3.D1(VSSQ) U3.D8(VSSQ) U3.E1(VSS) U3.E2(VSSQ) U3.E8(VSSQ) U3.F9(VSSQ) U3.G1(VSSQ) U3.G8(VSS) U3.G9(VSSQ) U3.J2(VSS) U3.J8(VSS) U3.M1(VSS) U3.M9(VSS) U3.P1(VSS) U3.P9(VSS) U3.T1(VSS) U3.T9(VSS) U20.4(PGND) U20.8(GND) U20.11(EP)
VTTREF: C123.1 C124.1 C127.2 C128.2 C165.1 U2.H1(VREFDQ) U2.M8(VREFCA) U3.H1(VREFDQ) U3.M8(VREFCA) U20.6(REFOUT)
DDR3_A0: R31.2 U2.N3(A0) U3.N3(A0)
DDR3_A1: R32.2 U2.P7(A1) U3.P7(A1)
DDR3_A2: R33.2 U2.P3(A2) U3.P3(A2)
DDR3_A3: R34.2 U2.N2(A3) U3.N2(A3)
DDR3_A4: R35.2 U2.P8(A4) U3.P8(A4)
DDR3_A5: R36.2 U2.P2(A5) U3.P2(A5)
DDR3_A6: R37.2 U2.R8(A6) U3.R8(A6)
DDR3_A7: R38.2 U2.R2(A7) U3.R2(A7)
DDR3_A8: R39.2 U2.T8(A8) U3.T8(A8)
DDR3_A9: R40.2 U2.R3(A9) U3.R3(A9)
DDR3_A10: R41.2 U2.L7(A10/AP) U3.L7(A10/AP)
DDR3_A11: R42.2 U2.R7(A11) U3.R7(A11)
DDR3_A12: R43.2 U2.N7(A12/~{BC}) U3.N7(A12/~{BC})
DDR3_A13: R44.2 U2.T3(A13) U3.T3(A13)
DDR3_A14: R45.2 U2.T7(A14) U3.T7(A14)
DDR3_BA0: R46.2 U2.M2(BA0) U3.M2(BA0)
DDR3_BA1: R47.2 U2.N8(BA1) U3.N8(BA1)
DDR3_BA2: R48.2 U2.M3(BA2) U3.M3(BA2)
DDR3_CAS: R51.2 U2.K3(~{CAS}) U3.K3(~{CAS})
DDR3_CKE: R54.2 U2.K9(CKE) U3.K9(CKE)
DDR3_CLK0_N: R57.1 U2.K7(~{CK}) U3.K7(~{CK})
DDR3_CLK0_P: R57.2 U2.J7(CK) U3.J7(CK)
DDR3_D0: U2.F8(DQ3)
DDR3_D1: U2.G2(DQ6)
DDR3_D2: U2.F2(DQ2)
DDR3_D3: U2.H3(DQ4)
DDR3_D4: U2.H8(DQ5)
DDR3_D5: U2.F7(DQ1)
DDR3_D6: U2.E3(DQ0)
DDR3_D7: U2.H7(DQ7)
DDR3_D8: U2.C3(DQ9)
DDR3_D9: U2.C2(DQ11)
DDR3_D10: U2.A3(DQ15)
DDR3_D11: U2.A2(DQ13)
DDR3_D12: U2.C8(DQ10)
DDR3_D13: U2.A7(DQ12)
DDR3_D14: U2.D7(DQ8)
DDR3_D15: U2.B8(DQ14)
DDR3_D16: U3.E3(DQ0)
DDR3_D17: U3.F2(DQ2)
DDR3_D18: U3.G2(DQ6)
DDR3_D19: U3.H3(DQ4)
DDR3_D20: U3.H7(DQ7)
DDR3_D21: U3.H8(DQ5)
DDR3_D22: U3.F7(DQ1)
DDR3_D23: U3.F8(DQ3)
DDR3_D24: U3.A3(DQ15)
DDR3_D25: U3.C8(DQ10)
DDR3_D26: U3.C3(DQ9)
DDR3_D27: U3.A7(DQ12)
DDR3_D28: U3.D7(DQ8)
DDR3_D29: U3.B8(DQ14)
DDR3_D30: U3.A2(DQ13)
DDR3_D31: U3.C2(DQ11)
DDR3_DM0: U2.E7(LDM)
DDR3_DM1: U2.D3(UDM)
DDR3_DM2: U3.E7(LDM)
DDR3_DM3: U3.D3(UDM)
DDR3_DQS0_N: U2.G3(~{LDQS})
DDR3_DQS0_P: U2.F3(LDQS)
DDR3_DQS1_N: U2.B7(~{UDQS})
DDR3_DQS1_P: U2.C7(UDQS)
DDR3_DQS2_N: U3.G3(~{LDQS})
DDR3_DQS2_P: U3.F3(LDQS)
DDR3_DQS3_N: U3.B7(~{UDQS})
DDR3_DQS3_P: U3.C7(UDQS)
DDR3_ODT: R53.2 U2.K1(ODT) U3.K1(ODT)
DDR3_RAS: R50.2 U2.J3(~{RAS}) U3.J3(~{RAS})
DDR3_RESET: R58.1 U2.T2(~{RESET}) U3.T2(~{RESET})
DDR3_S0: R49.2 U2.L2(~{CS}) U3.L2(~{CS})
DDR3_WE: R52.2 U2.L3(~{WE}) U3.L3(~{WE})
NetC166_1: C166.1 R30.1 R59.2 U20.1(REFIN)
NetR29_1: R29.1 U20.9(PGOOD)
NetR55_1: R55.1 U2.L8(ZQ)
NetR56_1: R56.1 U3.L8(ZQ)

Not connected (* = marked no-connect by the designer): U2 J1(NC)* J9(NC)* L1(NC)* L9(NC)* M7(NC)*; U3 J1(NC)* J9(NC)* L1(NC)* L9(NC)* M7(NC)*

### Layout directives
net class DDR3_ADDR: DDR3_A0, DDR3_A1, DDR3_A2, DDR3_A3, DDR3_A4, DDR3_A5, DDR3_A6, DDR3_A7, DDR3_A8, DDR3_A9, DDR3_A10, DDR3_A11, DDR3_A12, DDR3_A13, DDR3_A14, DDR3_BA0, DDR3_BA1, DDR3_BA2, DDR3_CAS, DDR3_CKE, DDR3_ODT, DDR3_RAS, DDR3_RESET, DDR3_S0, DDR3_WE
net class DDR3_D0: DDR3_D0, DDR3_D1, DDR3_D2, DDR3_D3, DDR3_D4, DDR3_D5, DDR3_D6, DDR3_D7, DDR3_DM0, DDR3_DQS0_N, DDR3_DQS0_P
net class DDR3_D1: DDR3_D8, DDR3_D9, DDR3_D10, DDR3_D11, DDR3_D12, DDR3_D13, DDR3_D14, DDR3_D15, DDR3_DM1, DDR3_DQS1_N, DDR3_DQS1_P
net class DDR3_D2: DDR3_D16, DDR3_D17, DDR3_D18, DDR3_D19, DDR3_D20, DDR3_D21, DDR3_D22, DDR3_D23, DDR3_DM2, DDR3_DQS2_N, DDR3_DQS2_P
net class DDR3_D3: DDR3_D28, DDR3_DM3, DDR3_DQS3_N, DDR3_DQS3_P

### Library data of the parts
C76-C111 C114-C128 C134 C165-C168 = Cap-S: 贴片瓷片电容
R29-R59 = Res: 贴片电阻
U2 U3 = CMP-2000-07475-2: IC DRAM 4G PARALLEL 96FBGA; Manufacturer: Micron; Access Time: 1.07ns; Nominal Supply Current: 12-156mA; Min Supply Voltage: 1.283V; Memory Type: SDRAM,DDR3; Standoff Height: 0.29mm; Max Supply Voltage: 1.45V; Memory Size: 4Gbits; Device Class L1: Integrated Circuits (ICs); Lead Free: Yes; ComponentLink2Description: Datasheet; Manufacturer Part Number: MT41K256M16TW-107:P; Category: IC; Digikey Description: IC DRAM 4G PARALLEL 96FBGA; Device Class L3: RAM; Interface: Parallel; RoHS: TRUE; Octopart: https://octopart.com/mt41k256m16tw-107%3Ap-micron-66533852; Temperature Range High: +85°C; ComponentLink2URL: https://www.micron.com/-/media/client/global/documents/products/data-sheet/dram/ddr3/4gb_ddr3l.pdf; Temperature: 0°C to +85°C; Package: TW; Device Class L2: Memory; Automotive: No; Height: 1.2mm; Temperature Range Low: 0°C
U20 = CMP-0395-00664-2: Single Output LDO, 3 A, 2.375 to 3.5 V Input, with DDR Termination, 10-pin SON (DRC), -40 to 85 degC, Green (RoHS & no Sb/Br); Manufacturer: Texas Instruments; Vin(Min)(V): 2.3; Vin(Max)(V): 3.5; SubFamily: Single Channel LDO; Iout(Max)(A): 3; Power Good: TRUE; Iq(Typ)(mA): 0.5; Rating: Catalog; ComponentLink1URL: http://www.ti.com/; ComponentLink3URL: http://www.ti.com/litv/pdf/mpds117k; PackageVersion: 4204102-3/L; Mounting Technology: Surface Mount; DatasheetVersion: SLUS812; Eco-Plan: Green (RoHS & no Sb/Br); ComponentLink4URL: Samples URL:http://www.ti.com/product/tps51200#samples; ComponentLink3Description: Package Specification; PackageReference: DRC0010J; ComponentLink2URL: http://www.ti.com/general/docs/lit/getliterature.tsp?genericPartNumber=TPS51200&fileType=pdf; ComponentLink2Description: Datasheet; PartNumber: TPS51200DRCR; PackageDescription: 10-Pin Plastic Small Outline, Body 3 x 3 mm, Pitch 0.5 mm; ComponentLink4Description: URL Link1; ComponentLink1Description: Manufacturer URL

## Sheet LAN_SD.SchDoc
size A4; SheetNumber: 5; SheetTotal: 11
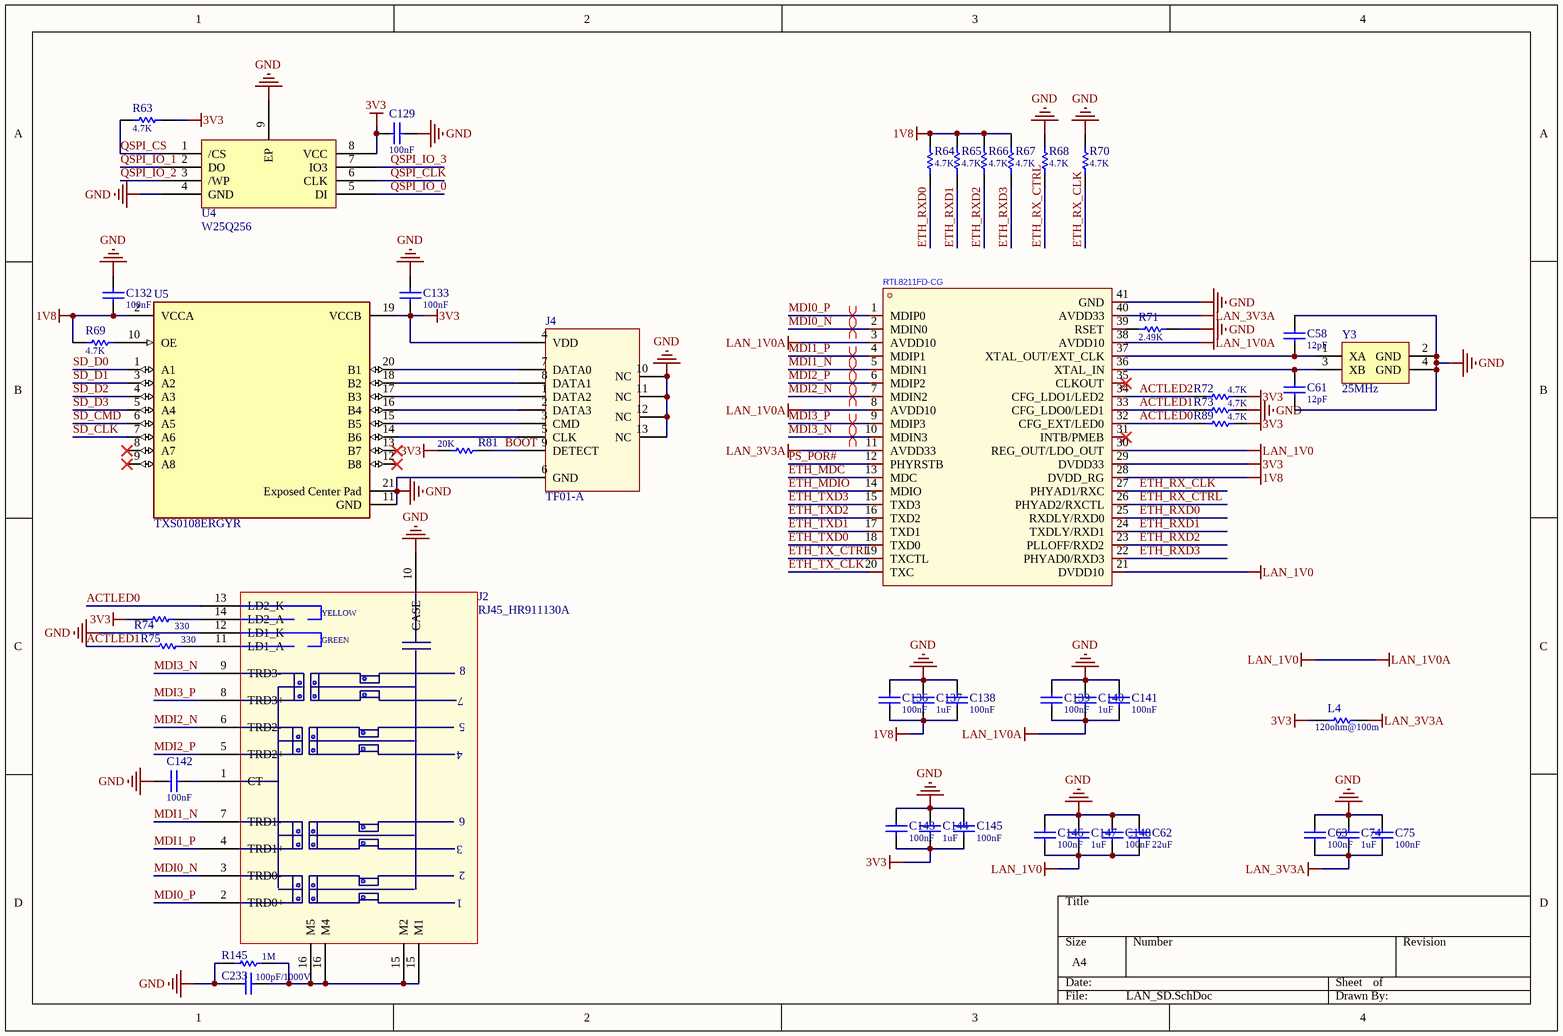
[diagram p4: LAN_SD.SchDoc]

### Parts
C58  value 12pF  [C0402-L]  (hidden comment: Cap-S)
C61  value 12pF  [C0402-L]  (hidden comment: Cap-S)
C62  value 22uF  [C0603-M]  (hidden comment: Cap-S)
C63  value 100nF  [C0402-L]  (hidden comment: Cap-S)
C74  value 1uF  [C0402-L]  (hidden comment: Cap-S)
C75  value 100nF  [C0402-L]  (hidden comment: Cap-S)
C129  value 100nF  [C0402-L]  (hidden comment: Cap-S)
C132  value 100nF  [C0402-L]  (hidden comment: Cap-S)
C133  value 100nF  [C0402-L]  (hidden comment: Cap-S)
C136  value 100nF  [C0402-L]  (hidden comment: Cap-S)
C137  value 1uF  [C0402-L]  (hidden comment: Cap-S)
C138  value 100nF  [C0402-L]  (hidden comment: Cap-S)
C139  value 100nF  [C0402-L]  (hidden comment: Cap-S)
C140  value 1uF  [C0402-L]  (hidden comment: Cap-S)
C141  value 100nF  [C0402-L]  (hidden comment: Cap-S)
C142  value 100nF  [C0603-M]  (hidden comment: Cap-S)
C143  value 100nF  [C0402-L]  (hidden comment: Cap-S)
C144  value 1uF  [C0402-L]  (hidden comment: Cap-S)
C145  value 100nF  [C0402-L]  (hidden comment: Cap-S)
C146  value 100nF  [C0402-L]  (hidden comment: Cap-S)
C147  value 1uF  [C0402-L]  (hidden comment: Cap-S)
C148  value 100nF  [C0402-L]  (hidden comment: Cap-S)
C233  value 100pF/1000V  [C1206-L]  (hidden comment: Cap-S)
J2  RJ45_HR911130A  [RJ45-TH_HR911130A]
J4  TF01-A  [TF-SMD_TF-01A]
L4  value 120ohm@100m  [R0603-L]  (hidden comment: R)
R63  value 4.7K  [R0402-L]  (hidden comment: R)
R64  value 4.7K  [R0402-L]  (hidden comment: R)
R65  value 4.7K  [R0402-L]  (hidden comment: R)
R66  value 4.7K  [R0402-L]  (hidden comment: R)
R67  value 4.7K  [R0402-L]  (hidden comment: R)
R68  value 4.7K  [R0402-L]  (hidden comment: R)
R69  value 4.7K  [R0402-L]  (hidden comment: R)
R70  value 4.7K  [R0402-L]  (hidden comment: R)
R71  value 2.49K  [R0402-L]  (hidden comment: R)
R72  value 4.7K  [R0402-L]  (hidden comment: R)
R73  value 4.7K  [R0402-L]  (hidden comment: R)
R74  value 330  [R0603-M]  (hidden comment: R)
R75  value 330  [R0603-M]  (hidden comment: R)
R81  value 20K  [R0402-L]  (hidden comment: R)
R89  value 4.7K  [R0402-L]  (hidden comment: R)
R145  value 1M  [R1206-L]  (hidden comment: R)
U4  W25Q256  [WPDFN-8_L8.0-W6.0-P1.27-EP-BL]
U5  TXS0108ERGYR  [FP-RGY0020A-MFG]
U6  RTL8211FD-CG  [WQFN-40_L5.0-W5.0-P0.4-BL-EP]
Y3  25MHz  [CRYSTAL-SMD_4P-L2.0-W1.6-BL]

### Nets
1V8: C132.1 C136.2 C137.2 C138.2 R64.1 R65.1 R66.1 R67.1 R69.2 U5.2(VCCA) U6.28(DVDD_RG)
3V3: C129.1 C133.1 C143.2 C144.2 C145.2 J4.4(VDD) L4.1 R63.2 R72.1 R74.1 R81.2 R89.1 U4.8(VCC) U5.19(VCCB) U6.29(DVDD33)
GND: C58.2 C61.1 C62.2 C63.1 C74.1 C75.1 C129.2 C132.2 C133.2 C136.1 C137.1 C138.1 C139.1 C140.1 C141.1 C142.2 C143.1 C144.1 C145.1 C146.1 C147.1 C148.1 C233.2 J2.10(CASE) J2.12(LD1_K) J4.6(GND) J4.10(NC) J4.11(NC) J4.12(NC) J4.13(NC) R68.1 R70.1 R71.2 R73.1 R145.1 U4.4(GND) U4.9(EP) U5.11(GND) U5.21(Exposed_Center_Pad) U6.41(GND) Y3.2(GND) Y3.4(GND)
LAN_1V0: C62.1 C139.2 C140.2 C141.2 C146.2 C147.2 C148.2 U6.3(AVDD10) U6.8(AVDD10) U6.21(DVDD10) U6.30(REG_OUT/LDO_OUT) U6.38(AVDD10)  [also labelled LAN_1V0A]
LAN_3V3A: C63.2 C74.2 C75.2 L4.2 U6.11(AVDD33) U6.40(AVDD33)
ACTLED0: J2.13(LD2_K) R89.2 U6.32(CFG_EXT/LED0)
ACTLED1: R73.2 R75.1 U6.33(CFG_LDO0/LED1)
ACTLED2: R72.2 U6.34(CFG_LDO1/LED2)
BOOT: J4.9(DETECT) R81.1
ETH_MDC: U6.13(MDC)
ETH_MDIO: U6.14(MDIO)
ETH_RX_CLK: R70.2 U6.27(PHYAD1/RXC)
ETH_RX_CTRL: R68.2 U6.26(PHYAD2/RXCTL)
ETH_RXD0: R64.2 U6.25(RXDLY/RXD0)
ETH_RXD1: R65.2 U6.24(TXDLY/RXD1)
ETH_RXD2: R66.2 U6.23(PLLOFF/RXD2)
ETH_RXD3: R67.2 U6.22(PHYAD0/RXD3)
ETH_TX_CLK: U6.20(TXC)
ETH_TX_CTRL: U6.19(TXCTL)
ETH_TXD0: U6.18(TXD0)
ETH_TXD1: U6.17(TXD1)
ETH_TXD2: U6.16(TXD2)
ETH_TXD3: U6.15(TXD3)
MDI0_N: J2.3(TRD0-) U6.2(MDIN0)
MDI0_P: J2.2(TRD0+) U6.1(MDIP0)
MDI1_N: J2.7(TRD1-) U6.5(MDIN1)
MDI1_P: J2.4(TRD1+) U6.4(MDIP1)
MDI2_N: J2.6(TRD2-) U6.7(MDIN2)
MDI2_P: J2.5(TRD2+) U6.6(MDIP2)
MDI3_N: J2.9(TRD3-) U6.10(MDIN3)
MDI3_P: J2.8(TRD3+) U6.9(MDIP3)
PS_POR#: U6.12(PHYRSTB)
QSPI_CLK: U4.6(CLK)
QSPI_CS: R63.1 U4.1(/CS)
QSPI_IO_0: U4.5(DI)
QSPI_IO_1: U4.2(DO)
QSPI_IO_2: U4.3(/WP)
QSPI_IO_3: U4.7(IO3)
SD_CLK: U5.7(A6)
SD_CMD: U5.6(A5)
SD_D0: U5.1(A1)
SD_D1: U5.3(A2)
SD_D2: U5.4(A3)
SD_D3: U5.5(A4)
NetC58_1: C58.1 U6.37(XTAL_OUT/EXT_CLK) Y3.1(XA)
NetC61_2: C61.2 U6.36(XTAL_IN) Y3.3(XB)
NetC142_1: C142.1 J2.1(CT)
NetC233_1: C233.1 J2.15(M2) J2.16(M5) R145.2
NetJ2_11: J2.11(LD1_A) R75.2
NetJ2_14: J2.14(LD2_A) R74.2
NetJ4_1: J4.1(DATA2) U5.17(B3)
NetJ4_2: J4.2(DATA3) U5.16(B4)
NetJ4_3: J4.3(CMD) U5.15(B5)
NetJ4_5: J4.5(CLK) U5.14(B6)
NetJ4_7: J4.7(DATA0) U5.20(B1)
NetJ4_8: J4.8(DATA1) U5.18(B2)
NetR69_1: R69.1 U5.10(OE)
NetR71_1: R71.1 U6.39(RSET)

Not connected (* = marked no-connect by the designer): U5 8(A7)* 9(A8)* 12(B8)* 13(B7)*; U6 31(INTB/PMEB)* 35(CLKOUT)*

### Layout directives
differential pair: MDI0_N, MDI0_P, MDI1_N, MDI1_P, MDI2_N, MDI2_P, MDI3_N, MDI3_P

### Notes on the sheet
- (in symbol RJ45_HR911130A) YELLOW; GREEN

### Library data of the parts
C58 C61-C63 C74 C75 C129 C132 C133 C136-C148 C233 = Cap-S: 贴片瓷片电容
J4 = TF01-A: TF卡卡槽
L4 R63-R75 R81 R89 R145 = Res: 贴片电阻
U5 = CMP-04899-000066-1: IC TRNSLTR BIDIRECTIONAL 20VQFN; Propagation Delay: 4.8ns; Number of Channels: 8; High Level Output Current: -50mA; Min Supply Voltage: 1.2V; Data Rate: 60Mbps; Quiescent Current: 3uA; Logic Function: Translator; Low Level Output Current: 50mA; Max Supply Voltage: 5.5V; Output Type: Voltage; Turn-On Delay Time: 312ns; Packaging: Tape and Reel; Min Operating Temperature: -40°C; Package Quantity: 1; Case/Package: VQFN; Mount: Surface Mount; Number of Pins: 20; Radiation Hardening: No; Series: -; RoHS Compliant: Yes; REACH SVHC: No SVHC; Max Operating Temperature: 85°C; Number of Bits: 8; Lead Free: Lead Free; Weight: 0.001517oz; Number of Inputs: 8
U6 = RTL8211F-CG: Manufacturer: REALTEK(瑞昱); Add into BOM: yes; Number of Channels: 4; Interface: RGMII; Supply Voltage: 1.8V；2.5V；3.3V；1.5V; Symbol: RTL8211F-CG; Device: RTL8211F-CG; LCSC Part Name: 集成10/100/1000M以太网精密收发器; Supplier Part: C187932; Manufacturer Part: RTL8211F-CG; Supplier Footprint: WQFN-40-EP(5x5); JLCPCB Part Class: Extended Part; Datasheet: https://atta.szlcsc.com/upload/public/pdf/source/20190902/C187932_1913F3711F05FE1324DF2946D70D648D.pdf; Supplier: LCSC; Convert to PCB: yes; Application Function: -
Y3 = XTAL-PASS